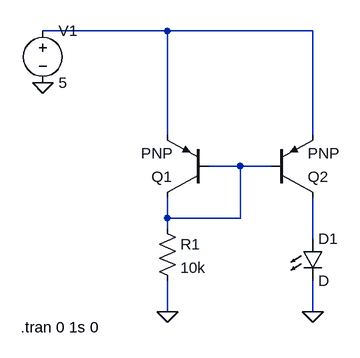
[diagram p0: schematic constant_current_led.asc]
constant_current_led.asc, the LTspice schematic file:
Version 4
SHEET 1 880 680
WIRE 112 -96 -80 -96
WIRE 336 -96 112 -96
WIRE 112 64 112 -96
WIRE 336 64 336 -96
WIRE 224 112 176 112
WIRE 272 112 224 112
WIRE 112 192 112 160
WIRE 224 192 224 112
WIRE 224 192 112 192
WIRE 112 208 112 192
WIRE 336 224 336 160
WIRE 112 336 112 288
WIRE 336 336 336 288
FLAG -80 -16 0
FLAG 112 336 0
FLAG 336 336 0
SYMBOL pnp 176 160 R180
SYMATTR InstName Q1
SYMBOL pnp 272 160 M180
SYMATTR InstName Q2
SYMBOL voltage -80 -112 R0
WINDOW 123 0 0 Left 0
WINDOW 39 0 0 Left 0
SYMATTR InstName V1
SYMATTR Value 5
SYMBOL res 96 192 R0
SYMATTR InstName R1
SYMATTR Value 10k
SYMBOL LED 320 224 R0
SYMATTR InstName D1
TEXT -114 360 Left 2 !.tran 0 1s 0

The netlist it stands for:
* constant_current_led.asc
Q1 N002 N002 N001 0 PNP
Q2 N003 N002 N001 0 PNP
V1 N001 0 5
R1 N002 0 10k
D1 N003 0 D
.model D D
.lib standard.dio
.model NPN NPN
.model PNP PNP
.lib standard.bjt
.tran 0 1s 0
.backanno
.end